# Altium project Zad.1.1.PrjPcb
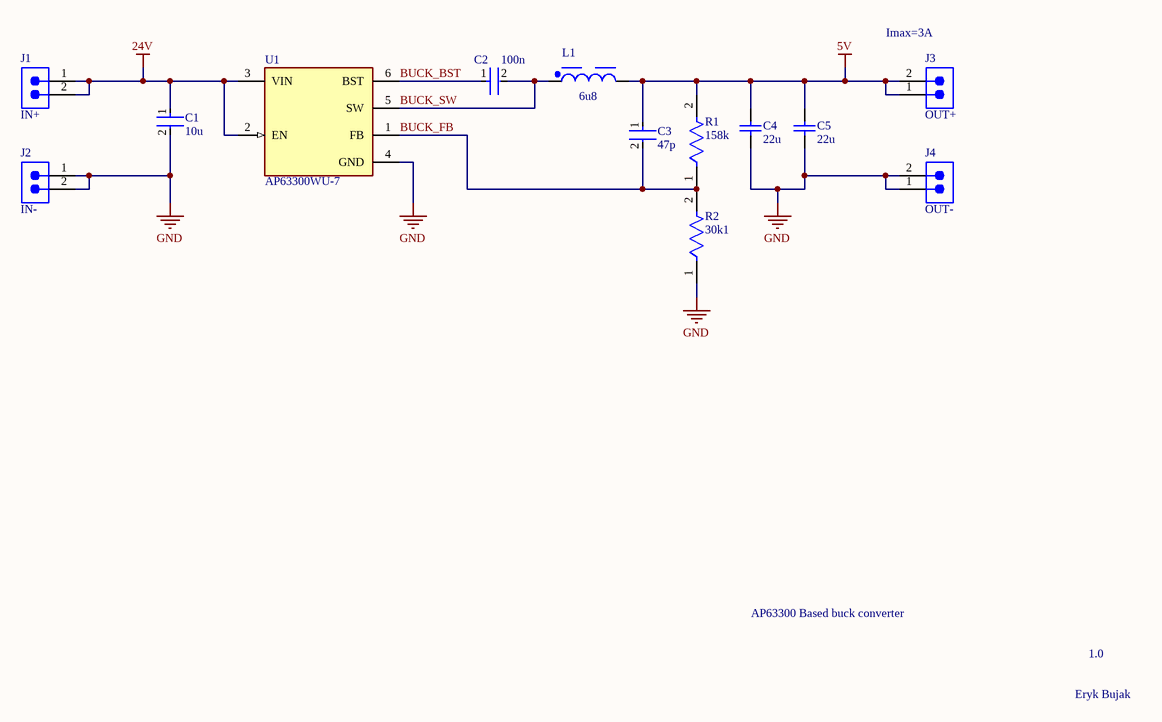
[diagram p0: BuckConverter.SchDoc]
1 sheet, 13 parts. Net scope: global (net labels, ports and power ports of the same name join across sheets).
Board file: BuckConverter.PcbDoc

## Sheet BuckConverter.SchDoc
size A4; SheetNumber: 1; SheetTotal: 1

### Parts
C1  10u  [FP-CC1210-GD-MFG]
C2  100n  [FP-C0603C-CF-MFG]
C3  47p  [FP-C0603C-CF-MFG]
C4  22u  [CAPC2013X152X50ML20T25]
C5  22u  [CAPC2013X152X50ML20T25]
J1  IN+  [SMTC-TSW-102-26-XX-S]
J2  IN-  [SMTC-TSW-102-26-XX-S]
J3  OUT+  [SMTC-TSW-102-26-XX-S]
J4  OUT-  [SMTC-TSW-102-26-XX-S]
L1  6u8  [WE-MXGI_5030]
R1  158k  [FP-AC0603-MFG]
R2  30k1  [FP-AC0603-MFG]
U1  AP63300WU-7  [FP-TSOT26-IPC_A]

### Nets
5V: C3.1 C4.2 C5.2 J3.1 J3.2 L1.2 R1.2
24V: C1.1 J1.1 J1.2 U1.2(EN) U1.3(VIN)
GND: C1.2 C4.1 C5.1 J2.1 J2.2 J4.1 J4.2 R2.1 U1.4(GND)
BUCK_BST: C2.1 U1.6(BST)
BUCK_FB: C3.2 R1.1 R2.2 U1.1(FB)
BUCK_SW: C2.2 L1.1 U1.5(SW)

### Notes on the sheet
- (near J3) Imax=3A
- AP63300 Based buck converter
- 1.0
- Eryk Bujak

### Library data of the parts
C1 = CMP-03422-001447-1: CAP CER 10UF 50V X7R 1210; Tolerance: 20%; Case/Package: 1210; Max Operating Temperature: 125°C; Case Code (Imperial): 1210; Voltage Rating: 50V; Mount: Surface Mount; Packaging: Tape and Reel; Min Operating Temperature: -55°C; Case Code (Metric): 3225; Capacitance: 10uF; RoHS Compliant: Yes
C2 = CMP-2006-03056-2: CAP CER 0.1UF 50V 5% X7R 0603; Manufacturer Part Number: C0603C104J5RACTU; Manufacturer: KEMET; Automotive Grade: Grade 1; Tolerance: 0.05; Capacitance: 0.10 μF; Value: 0.10 μF; Material: Ceramic; Temperature Coefficient: 30ppm/°C; ComponentLink2Description: Datasheet; Voltage Rating: 50 V; Digikey Description: CAP CER 0.1UF 50V 5% X7R 0603; Temperature Range High: +125°C; Device Class L2: Capacitors; Octopart: https://octopart.com/c0603c104j5ractu-kemet-10440638; RoHS: TRUE; Mouser Description: Multilayer Ceramic Capacitors MLCC - SMD/SMT 50volts 0.1uF X7R 5%; Temperature Range Low: -55°C; Automotive: Yes; Lead Free: Yes; ComponentLink2URL: https://api.kemet.com/component-edge/download/datasheet/C0603C100J5GACAUTO.pdf; Device Class L3: Ceramic Capacitors; Package: C0603C-CF; Category: Cap; Temperature: -55°C to +125°C; Height: 0.87mm; Temperature Characteristic: X7R; Device Class L1: Passive Components
C3 = CMP-03020-009961-1: C0603 47 pF X8R 30ppm/°C 10.00% 50 V; Manufacturer: KEMET; Manufacturer Part Number: C0603C470K5HACAUTO; Capacitance: 47 pF; Automotive Grade: Grade 1; Voltage Rating: 50 V; Value: 47 pF; Material: Ceramic; Tolerance: 0.1; Package: C0603C-CF; Device Class L3: Ceramic Capacitors; Temperature: -55°C to +125°C; Automotive: Yes; Device Class L1: Passive Components; ComponentLink2Description: Datasheet; Device Class L2: Capacitors; Lead Free: Yes; Temperature Coefficient: 30ppm/°C; Height: 0.87mm; RoHS: TRUE; Category: Cap; Temperature Range Low: -55°C; Octopart: https://octopart.com/c0603c470k5hacauto-kemet-88089032; ComponentLink2URL: https://api.kemet.com/component-edge/download/datasheet/C0603C100J5GACAUTO.pdf; Temperature Range High: +125°C; Temperature Characteristic: X8R
C4 C5 = CMP-2007-04522-1: Manufacturer: AVX Interconnect / Elco; Part Number: 0805ZD226MAT2A
J1-J4 = CMP-1024-00329-1: 0.025" SQ Post Header, Through-hole, Vertical, -55 to 125 degC, 2.54 mm Pitch, 2-Pin, Male, RoHS; PartNumber: TSW-102-26-F-S; Manufacturer: Samtec; Pitch: 2.54 mm; PackageVersion: DM, 8/1988; ComponentLink2Description: Datasheet; PackageReference: TSW-102-26-XX-S; ComponentLink3URL: http://www.samtec.com/documents/webfiles/cpdf/TSW-XXX-XX-XXX-X-XX-XXX-MKT.pdf; ComponentLink2URL: http://www.samtec.com/documents/webfiles/pdf/TSW_TH.PDF; ComponentLink1Description: Manufacturer URL; DatasheetVersion: F-214; RoHS: True; ComponentLink3Description: Package Specification; Temperature Range: -55 to 125 degC; Orientation: Vertical; ComponentLink1URL: http://www.samtec.com; PackageDescription: .025[0.64] SQ. Post Terminal Strip Assembly; Mounting Technology: Through-hole
L1 = CMP-03913-160330172-1: SMD Pwr Ind, 6.8UH, 20%, 6.5A, Shielded Rohs Compliant: Yes
R1 = CMP-03412-016958-2: RES 158KΩ 1.00% 0.1W 0603; Max Power Dissipation: 100mW; Tolerance: 1%; Resistance: 158kR; Temperature Coefficient: 100ppm/°C; Features: Moisture Resistant; Series: AC; Number of Terminations: 2; RoHS Compliant: Yes; Packaging: Tape and Reel; Height: 0.022inch; Length: 0.063inch; Resistor Type: Thick Film; Width: 0.031inch; Max Operating Temperature: 155°C; Case/Package: 0603; Min Operating Temperature: -55°C
R2 = CMP-03412-014283-2: RES 30.1KΩ 1.00% 0.1W 0603; Resistance: 30.1kR; Temperature Coefficient: 100ppm/°C; Tolerance: 1%; Voltage Rating: 50V; Power Rating: 100mW; Case Code (Imperial): 0603; RoHS Compliant: Yes; Max Operating Temperature: 155°C; Series: AC; Lead Free: Lead Free; Packaging: Tape and Reel; Height: 0.022inch; Case Code (Metric): 1608; Case/Package: 0603; Min Operating Temperature: -55°C; Max Power Dissipation: 100mW; Number of Terminations: 2; Width: 0.8mm; Resistor Type: Thick Film; Termination: SMD/SMT; Features: Moisture Resistant; Length: 0.063inch
U1 = CMP-12757-000025-1: DCDC CONV HV BUCK TSOT26